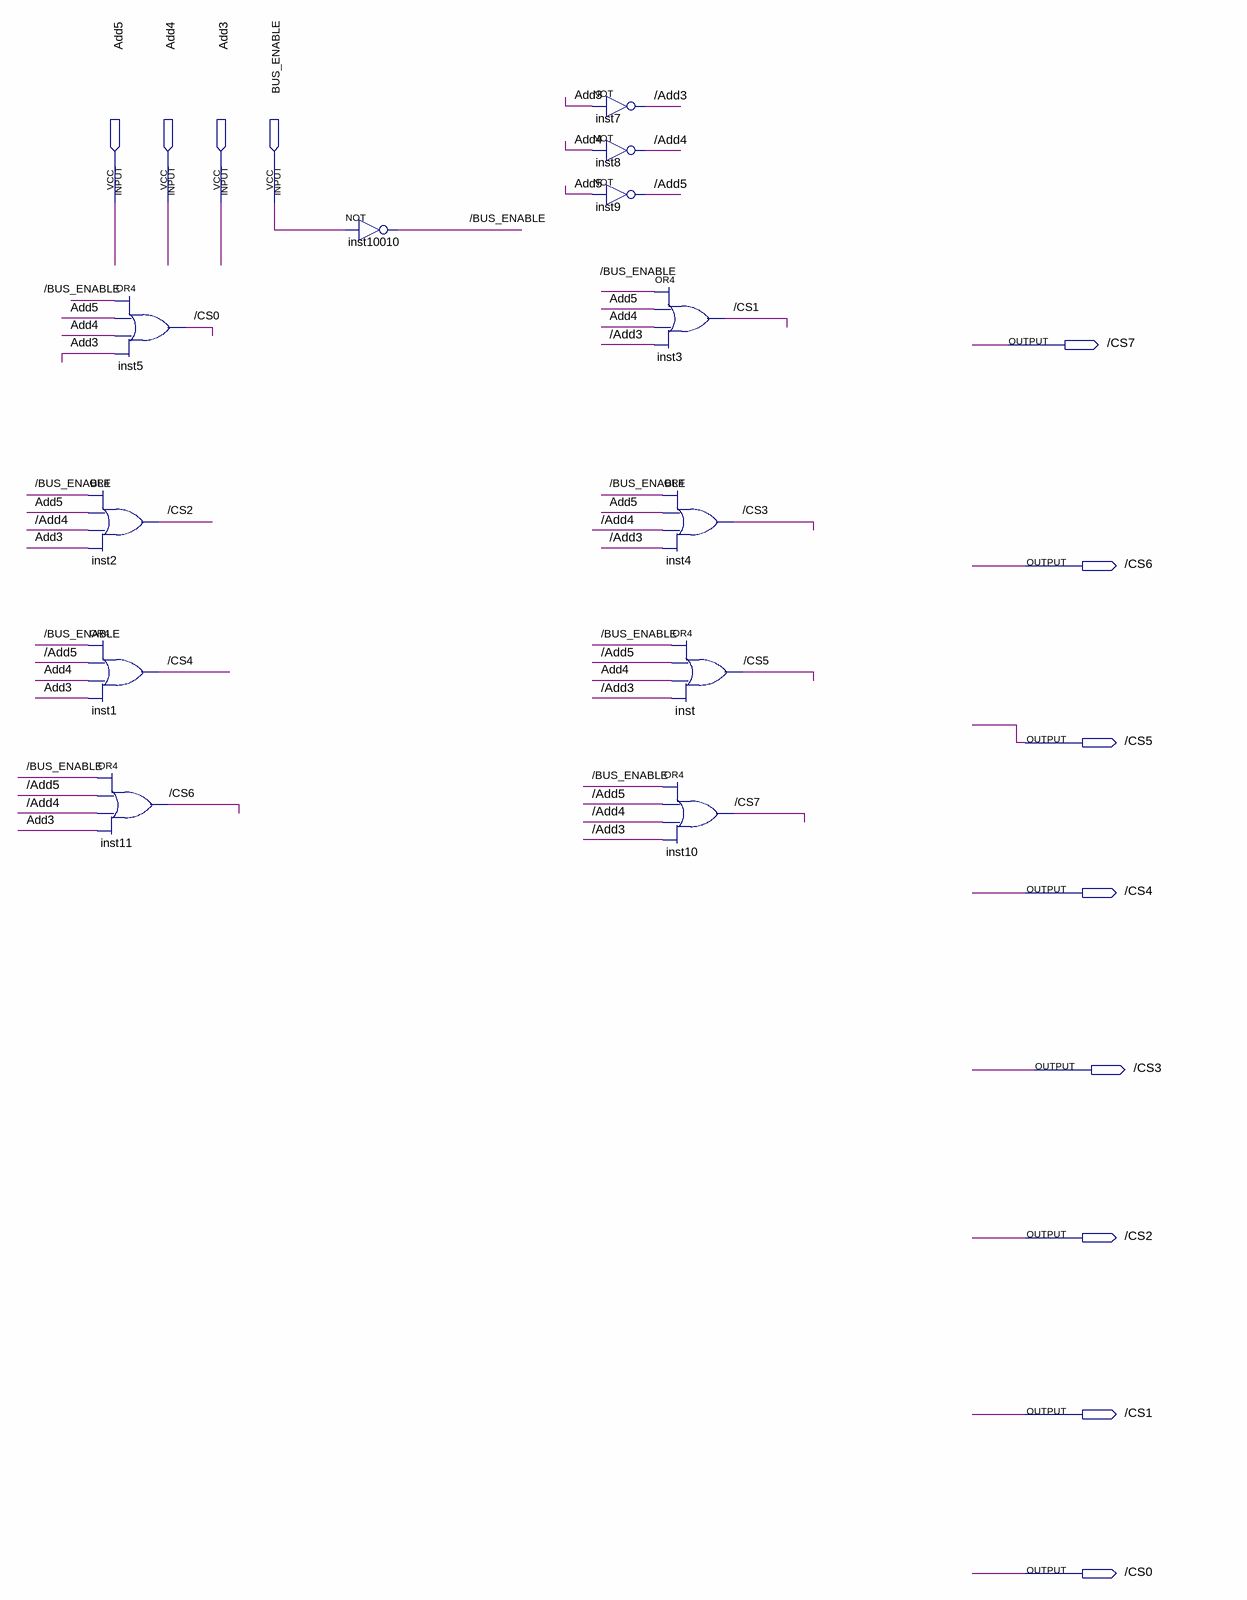
[diagram p0: schematic sheet]
// Quartus schematic DECODAGE_ROBOT.bdf as structural Verilog: 12 symbols, 12 pins
module DECODAGE_ROBOT (
  input  Add5,
  input  Add4,
  input  Add3,
  input  BUS_ENABLE,
  output \/CS7 ,
  output \/CS6 ,
  output \/CS5 ,
  output \/CS4 ,
  output \/CS3 ,
  output \/CS2 ,
  output \/CS1 ,
  output \/CS0 
);

  wire \/Add3 , \/Add4 , \/Add5 , \/BUS_ENABLE ;

  or inst2 (\/CS2 , \/BUS_ENABLE , Add5, \/Add4 , Add3);
  or inst1 (\/CS4 , \/BUS_ENABLE , \/Add5 , Add4, Add3);
  or inst5 (\/CS0 , \/BUS_ENABLE , Add5, Add4, Add3);
  or inst11 (\/CS6 , \/BUS_ENABLE , \/Add5 , \/Add4 , Add3);
  not inst10010 (\/BUS_ENABLE , BUS_ENABLE);
  not inst7 (\/Add3 , Add3);
  not inst8 (\/Add4 , Add4);
  not inst9 (\/Add5 , Add5);
  or inst3 (\/CS1 , \/BUS_ENABLE , Add5, Add4, \/Add3 );
  or inst4 (\/CS3 , \/BUS_ENABLE , Add5, \/Add4 , \/Add3 );
  or inst (\/CS5 , \/BUS_ENABLE , \/Add5 , Add4, \/Add3 );
  or inst10 (\/CS7 , \/BUS_ENABLE , \/Add5 , \/Add4 , \/Add3 );
endmodule
